# Altium project Charge_PREAMP.PrjPcb
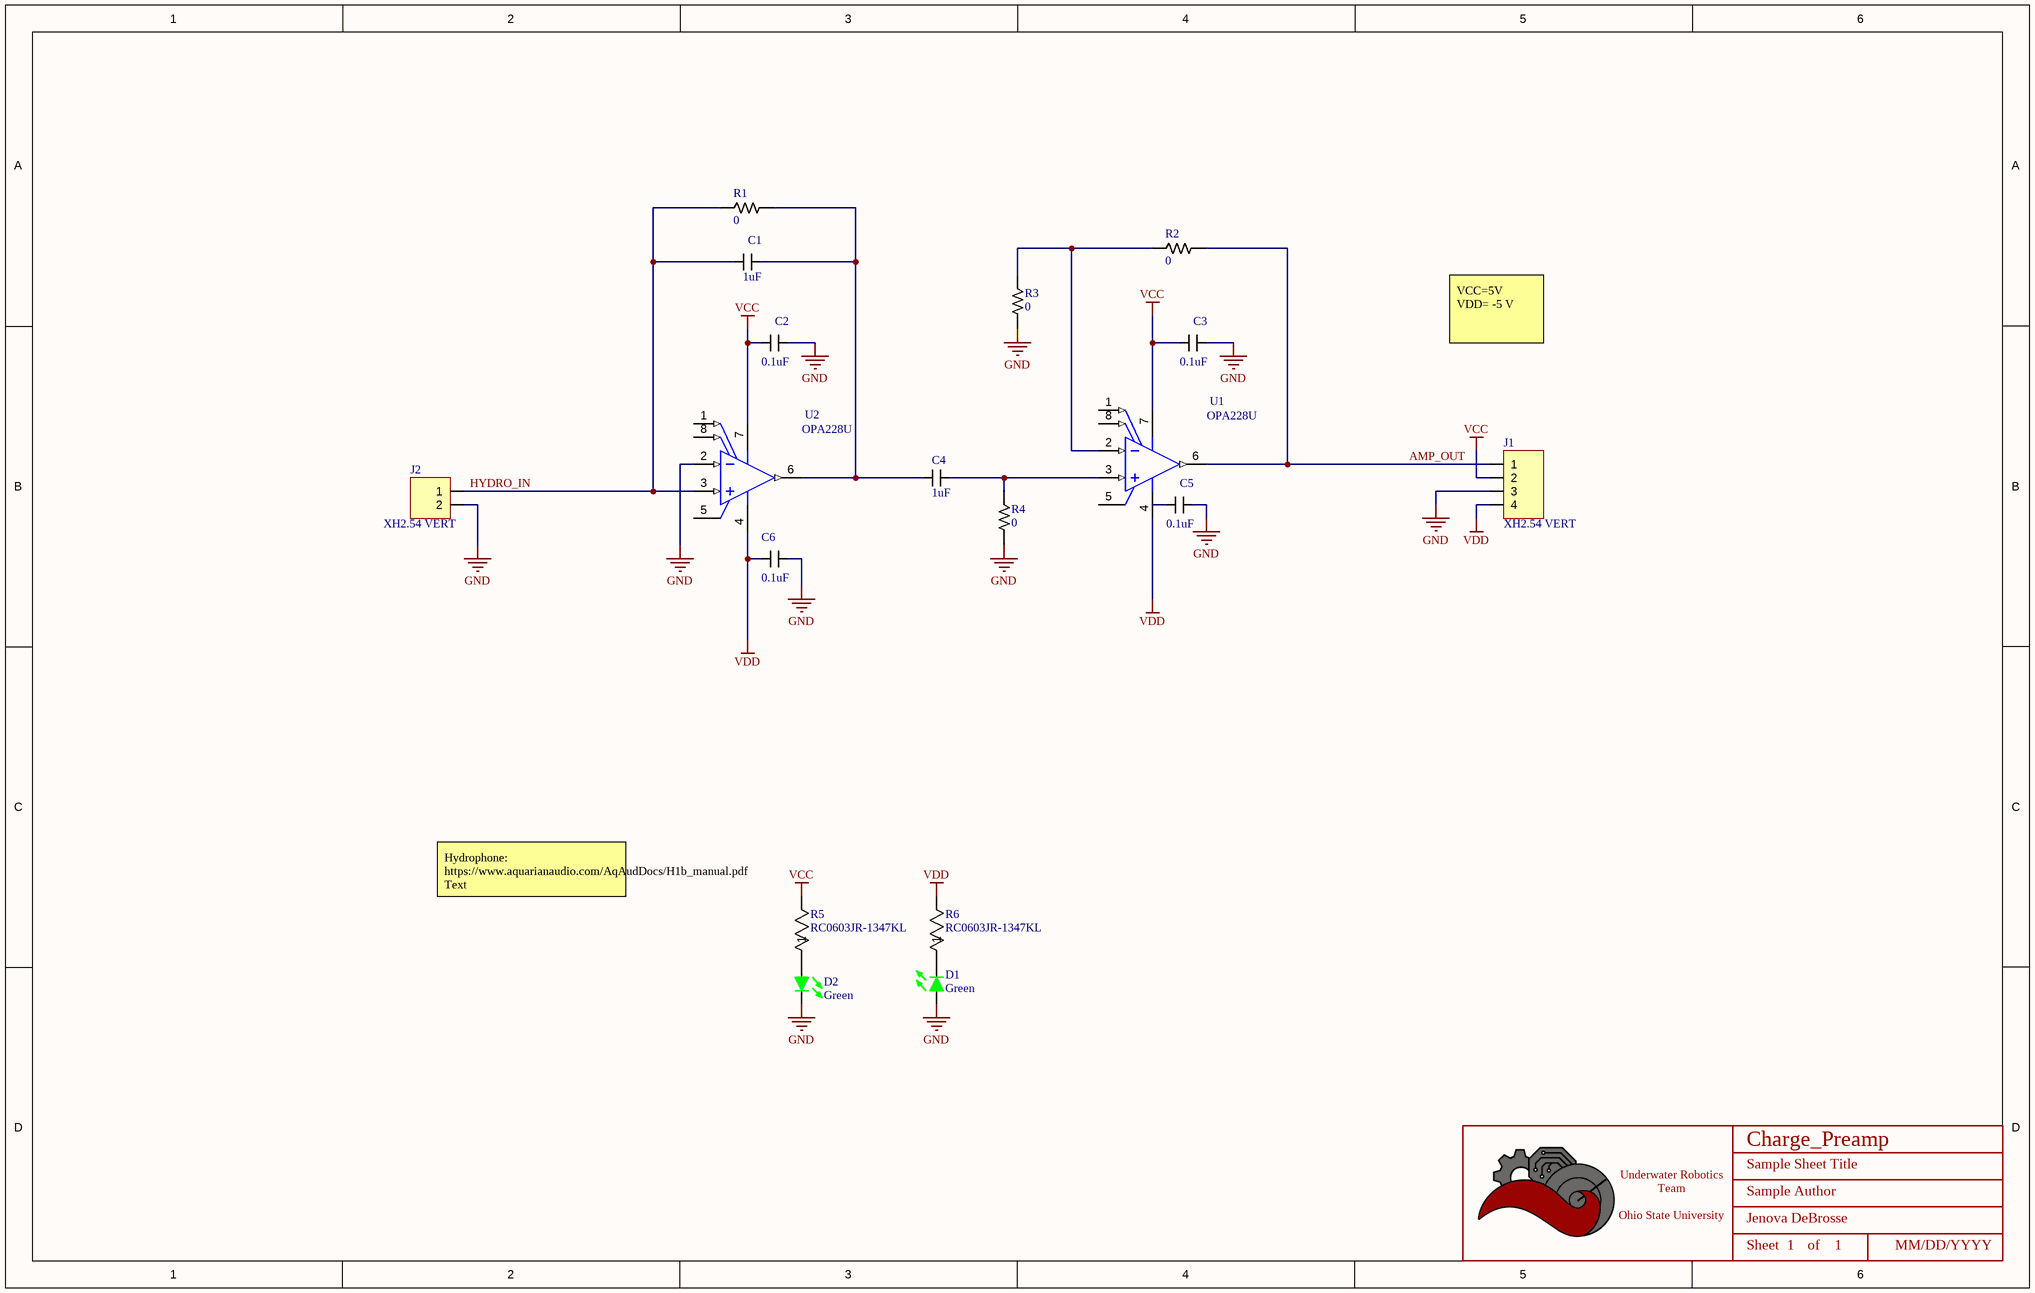
[diagram p0: ChargePreAmp.SchDoc]
BoardRevision: 1.0; DateOfDesignReview: XX/XX/XXXX; ProjectTitle: Charge_Preamp; TeamLead: Jenova DeBrosse
1 sheet, 19 parts. Net scope: global (net labels, ports and power ports of the same name join across sheets).
Board files: Pcb_4layer_4x4_Template.PcbDoc, Pcb_2layer_4x4_Template.PcbDoc, Pcb_2layer_8x4_Template_NoCenterHoles.PcbDoc, Pcb_4layer_8x4_Template_NoCenterHoles.PcbDoc, Pcb_2layer_8x4_Template.PcbDoc, Pcb_4layer_8x4_Template.PcbDoc

## Sheet ChargePreAmp.SchDoc: Sample Sheet Title
size B; Date: MM/DD/YYYY; Author: Sample Author; Organization: ORGANIZATION; Address1: ADDRESS 1; Address2: ADDRESS 2; Address3: ADDRESS 3; Address4: ADDRESS 4; Revision: -; SheetNumber: 1; SheetTotal: 1; ENG_APP_DATE: --/--/--; DSN_APP_DATE: --/--/--; CHK_APP_DATE: --/--/--

### Parts
*  Title_Block  [LOGO]  (value not drawn)  (graphical)
C1  value 1uF  [CAPACITOR_0402]  (hidden comment: 1uF Ceramic 16V)
C2  Capacitance: 0.1uF  [CAPACITOR_0402]  (hidden comment: *CL05A104KA5NNNC)
C3  Capacitance: 0.1uF  [CAPACITOR_0402]  (hidden comment: *CL05A104KA5NNNC)
C4  value 1uF  [CAPACITOR_0402]  (hidden comment: 1uF Ceramic 16V)
C5  Capacitance: 0.1uF  [CAPACITOR_0402]  (hidden comment: *CL05A104KA5NNNC)
C6  Capacitance: 0.1uF  [CAPACITOR_0402]  (hidden comment: *CL05A104KA5NNNC)
D1  Color: Green  [LED_0603]  (hidden comment: 150060GS75000)
D2  Color: Green  [LED_0603]  (hidden comment: 150060GS75000)
J1  XH2.54 VERT  [CONN_JST_XH254_4POS_VERT]
J2  XH2.54 VERT  [CONN_JST_XH254_2POS_VERT]
R1  Value  (Ohms): 0  [RESISTOR_0402]  (hidden comment: 0 Ohm 1% 1/16W)
R2  Value  (Ohms): 0  [RESISTOR_0402]  (hidden comment: 0 Ohm 1% 1/16W)
R3  Value  (Ohms): 0  [RESISTOR_0402]  (hidden comment: 0 Ohm 1% 1/16W)
R4  Value  (Ohms): 0  [RESISTOR_0402]  (hidden comment: 0 Ohm 1% 1/16W)
R5  RC0603JR-1347KL  [RESISTOR_0603]
R6  RC0603JR-1347KL  [RESISTOR_0603]
U1  OPA228U  [D0008A_M]
U2  OPA228U  [D0008A_M]

### Nets
GND: C2.1 C3.1 C5.1 C6.1 D1.1 D2.2 J1.3 J2.2 R3.1 R4.1 U2.2(IN-)
VCC: C2.2 C3.2 J1.2 R5.2 U1.7(V+) U2.7(V+)
VDD: C6.2 J1.4 R6.2 U1.4(V-) U2.4(V-)
AMP_OUT: J1.1 R2.1 U1.6(OUT)
HYDRO_IN: C1.2 J2.1 R1.2 U2.3(IN+)
NetC1_1: C1.1 C4.2 R1.1 U2.6(OUT)
NetC4_1: C4.1 R4.2 U1.3(IN+)
NetD1_2: D1.2 R6.1
NetD2_1: D2.1 R5.1
NetR2_2: R2.2 R3.2 U1.2(IN-)

Not connected (* = marked no-connect by the designer): C5 2; U1 1(TRIM) 5(NC) 8(TRIM); U2 1(TRIM) 5(NC) 8(TRIM)

### Notes on the sheet
- VCC=5V
  VDD= -5 V
- Hydrophone:
  https://www.aquarianaudio.com/AqAudDocs/H1b_manual.pdf Text
- DWG. NO.
- REV.
- SHT.
- THIS DOCUMENT AND THE DATA DISCLOSED HEREIN OR HEREWITH IS THE PROPERTY OF ALTIUM LIMITED AND MAY BE FREELY DISTRIBUTED IN WHOLE. NO RIGHTS ARE RESERVED OR EXPRESS OR IMPLIED WARANTEE GIVEN.
- REVISION
- DESCRIPTION
- DATE
- APPROVED
- ENG:
- APPROVALS
- PROJECT
- DSN:
- CHK:
- REFERENCE DOCUMENTS
- PROJECT REVISION:
- TITLE
- DOCUMENT REVISION:
- DESIGN ITEM:
- BOM:
- FAB DWG:
- PCB DWG:
- ASSY DWG:
- SCALE:
- SIZE
- B
- CAGE CODE
- FILE NAME
- DWG NO.
- SHEET
- OF
- REV
- (in symbol Title_Block) Underwater Robotics Team / Ohio State University; Sheet; of

### Library data of the parts
* = Title_Block: UWRT Schematic Title Block Template / Created June 2021, Dylan Trainor
C1 C4 = CAPACITOR_1uF_0402: Cap 1uF 16V +/-10% / Ceramic 0402; Made By: Robert Pafford; Tolerance: +/- 10%; Voltage: 16V; Supplier 1: Digi-Key; Supplier Part Number 1: 478-0402YD105KAT4ADKR-ND
C2 C3 C5 C6 = CAP CER 0.1UF 25V X5R 0402: 0.1 µF ±10% 25V Ceramic Capacitor X5R 0402 (1005 Metric); Name: Zach Ramsey; Tolerance: +/- 10%; ComponentLink1Description: Data Sheet; ComponentLink1URL: https://mm.digikey.com/Volume0/opasdata/d220001/medias/docus/503/CL05A104KA5NNNC.pdf; Rated Voltage: 25V; Supplier 1: Arrow Electronics; Supplier Part Number 1: CL05A104KA5NNNC
D1 D2 = LED_Green_0603_3.2V: LED Green Vf= 3.2V If = 0.025A / 150060GS75000; Made By: Flip B; Forward Current: 25mA; Supplier 1: Digi-Key; ComponentLink1Description: Datasheet; ComponentLink1URL: https://www.we-online.de/katalog/datasheet/150060GS75000.pdf; Supplier Part Number 1: 732-4971-1-ND; Forward Voltage: 3.2V; Package: 0603
J1 = CONN_JST_XH254_4POS_VERT: JST XH 2.54mm Pitch 4 Pos Vertical; Current Per Pin: 4A; Number of Positions: 4; NOTE: Do not use JST 2.5mm parts with this footprint. JST does not make 2.54mm pitch pins, rather only clones make this connector!; Manufacturer: JST; Pitch: 2.54mm; Configuration: Vertical; Color: White; Created By: Robert P; Series: XH 2.54; ComponentLink1Description: Purchase Link; ComponentLink1URL: https://www.amazon.com/460PCS-XH2-54-Connector-Terminal-Connectors/dp/B09DBGVX5C
J2 = CONN_JST_XH254_2POS_VERT: JST XH 2.54mm Pitch 2 Pos Vertical; Current Per Pin: 4A; Number of Positions: 2; NOTE: Do not use JST 2.5mm parts with this footprint. JST does not make 2.54mm pitch pins, rather only clones make this connector!; Manufacturer: JST; Pitch: 2.54mm; Configuration: Vertical; Color: White; Created By: Robert P; Series: XH 2.54; ComponentLink1Description: Purchase Link; ComponentLink1URL: https://www.amazon.com/460PCS-XH2-54-Connector-Terminal-Connectors/dp/B09DBGVX5C
R1-R4 = RESISTOR_0_0402: RES 0 OHM 1% 1/16W 0402; Tolerance: +/- 1%; Made By: Robert Pafford; Wattage: 1/16W; Supplier 1: Digikey; Supplier Part Number 1: 13-AC0402FR-070RLCT-ND
R5 R6 = RC0603JR-1347KL: 47kohm 0603 1/10w; Mfr_Name: Yageo; Copyright: Copyright (C) 2024 Ultra Librarian. All rights reserved.; Manufacturer_Part_Number: RC0603JR-1347KL; RefDes: RefDes; Type: DEV; Supplier 1: Mouser; Supplier Part Number 1: 603-RC0603JR-1347KL
U1 U2 = CMP-0272-00518-3: High Precision, Low Noise Operational Amplifier, 5 to 36 V, -55 to 125 degC, 8-pin SOIC (D8), Green (RoHS & no Sb/Br); Manufacturer: Texas Instruments; Slew Rate(Typ)(V/us): 11; Sub Family: High Supply Voltage Amplifier (>=30V), Low Noise Amp (<=10nV/rtHz), Low Offset Voltage Amplifier (<=500uV), Precision Amplifier; Total Supply Voltage(Min)(+5V is 5, +/-5V is 10): 5; Vio (25C)(Max)(mV): 0.075; IIB(Max)(pA): 10000; Total Supply Voltage(Max)(+5V is 5, +/-5V is 10): 36; Number of Channels: 1; Offset Drift(Typ)(uV/C): 0.1; Packing: TUBE; CMRR(Min)(dB): 120; Rating: Catalog; GBW(Typ)(MHz): 33; Iq per channel(Max)(mA): 3.8; Eco-Plan: Green (RoHS & no Sb/Br); ComponentLink3URL: http://www.ti.com/litv/pdf/msoi002j; Code_JEDEC: MS-012; ComponentLink2Description: Datasheet; PackageReference: D0008A; Mounting Technology: Surface Mount; PackageDescription: 8-Pin Plastic Small Outline, Body 4.9 x 3.9 mm, Pitch 1.27 mm; PartNumber: OPA228U; PackageVersion: 4040047-3/M, 06/2011; DatasheetVersion: SBOS110A; ComponentLink3Description: Package Specification; ComponentLink1Description: Manufacturer URL; ComponentLink2URL: http://www.ti.com/lit/ds/symlink/opa228.pdf; ComponentLink1URL: http://www.ti.com/